# Altium schematic sheet FPGA_VREG.SchDoc
size 297 x 209 mm
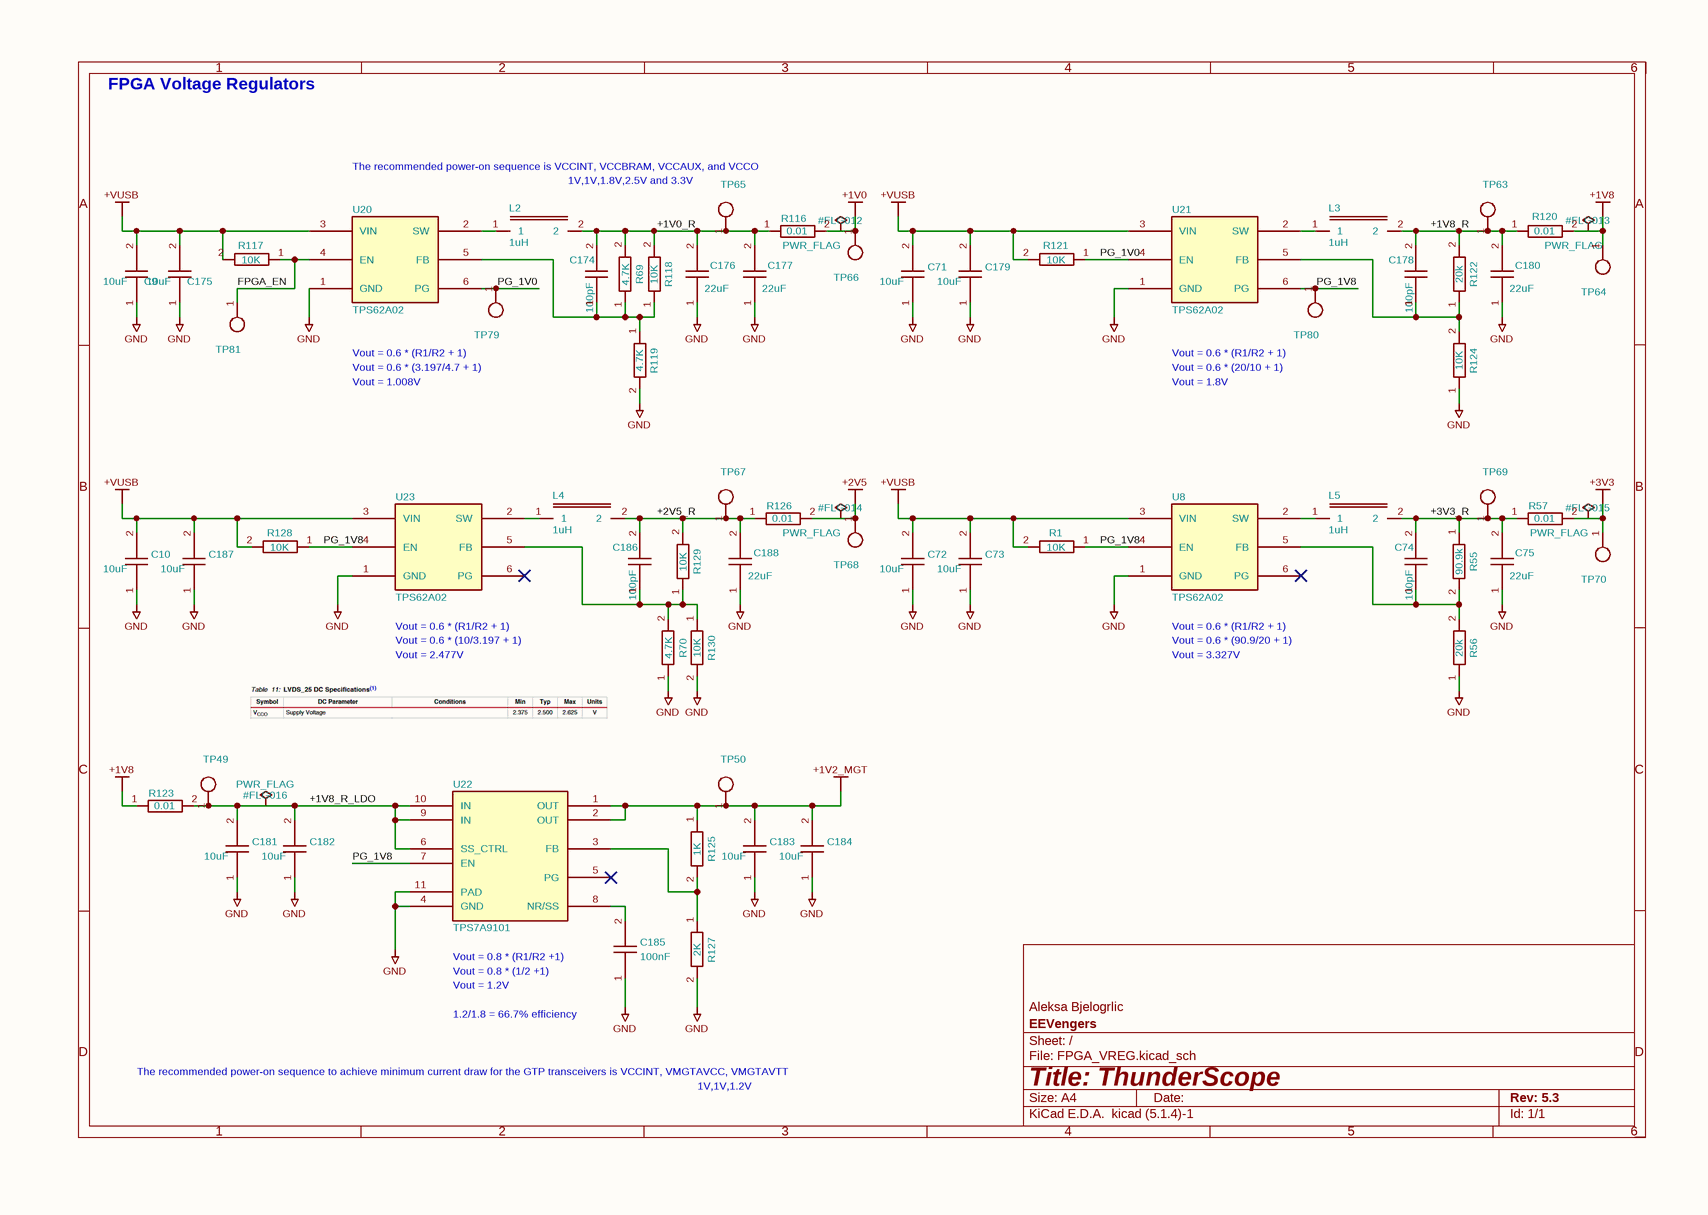
[diagram p0: FPGA_VREG.SchDoc]

## Parts
#FLG012  PWR_FLAG  (graphical)
#FLG013  PWR_FLAG  (graphical)
#FLG014  PWR_FLAG  (graphical)
#FLG015  PWR_FLAG  (graphical)
#FLG016  PWR_FLAG  (graphical)
C9  10uF  [GEN_C_0603]
C10  10uF  [GEN_C_0603]
C71  10uF  [GEN_C_0603]
C72  10uF  [GEN_C_0603]
C73  10uF  [GEN_C_0603]
C74  100pF  [GEN_C_0402]
C75  22uF  [GEN_C_0805]
C174  100pF  [GEN_C_0402]
C175  10uF  [GEN_C_0603]
C176  22uF  [GEN_C_0805]
C177  22uF  [GEN_C_0805]
C178  100pF  [GEN_C_0402]
C179  10uF  [GEN_C_0603]
C180  22uF  [GEN_C_0805]
C181  10uF  [GEN_C_0603]
C182  10uF  [GEN_C_0603]
C183  10uF  [GEN_C_0603]
C184  10uF  [GEN_C_0603]
C185  100nF  [GEN_C_0402]
C186  100pF  [GEN_C_0402]
C187  10uF  [GEN_C_0603]
C188  22uF  [GEN_C_0805]
L2  1uH  [GEN_L_1210]
L3  1uH  [GEN_L_1210]
L4  1uH  [GEN_L_1210]
L5  1uH  [GEN_L_1210]
R1  10K  [GEN_R_0402]
R55  90.9k  [GEN_R_0402]
R56  20k  [GEN_R_0402]
R57  0.01  [GEN_R_0603]
R69  4.7K  [GEN_R_0402]
R70  4.7K  [GEN_R_0402]
R116  0.01  [GEN_R_0603]
R117  10K  [GEN_R_0402]
R118  10K  [GEN_R_0402]
R119  4.7K  [GEN_R_0402]
R120  0.01  [GEN_R_0603]
R121  10K  [GEN_R_0402]
R122  20k  [GEN_R_0402]
R123  0.01  [GEN_R_0603]
R124  10K  [GEN_R_0402]
R125  1K  [GEN_R_0402]
R126  0.01  [GEN_R_0603]
R127  2K  [GEN_R_0402]
R128  10K  [GEN_R_0402]
R129  10K  [GEN_R_0402]
R130  10K  [GEN_R_0402]
TP49  PCB  [GEN_TP_PCB]  (value not drawn)
TP50  PCB  [GEN_TP_PCB]  (value not drawn)
TP63  PCB  [GEN_TP_PCB]  (value not drawn)
TP64  PCB  [GEN_TP_PCB]  (value not drawn)
TP65  PCB  [GEN_TP_PCB]  (value not drawn)
TP66  PCB  [GEN_TP_PCB]  (value not drawn)
TP67  PCB  [GEN_TP_PCB]  (value not drawn)
TP68  PCB  [GEN_TP_PCB]  (value not drawn)
TP69  PCB  [GEN_TP_PCB]  (value not drawn)
TP70  PCB  [GEN_TP_PCB]  (value not drawn)
TP79  PCB  [GEN_TP_PCB]  (value not drawn)
TP80  PCB  [GEN_TP_PCB]  (value not drawn)
TP81  PCB  [GEN_TP_PCB]  (value not drawn)
U8  TPS62A02  [TI_SOT563_DRL0006A]
U20  TPS62A02  [TI_SOT563_DRL0006A]
U21  TPS62A02  [TI_SOT563_DRL0006A]
U22  TPS7A9101  [TI_WSON10_DSK0010A]
U23  TPS62A02  [TI_SOT563_DRL0006A]

## Nets
+1V0: #FLG012.1 R116.2 TP66.1
+1V2_MGT: C183.2 C184.2 R125.1 TP50.1 U22.1(OUT) U22.2(OUT)
+1V8: #FLG013.1 R120.2 R123.1 TP64.1
+2V5: #FLG014.1 R126.2 TP68.1
+3V3: #FLG015.1 R57.2 TP70.1
+VUSB: C9.2 C10.2 C71.2 C72.2 C73.2 C175.2 C179.2 C187.2 R1.2 R117.2 R121.2 R128.2 U8.3(VIN) U20.3(VIN) U21.3(VIN) U23.3(VIN)
GND: C9.1 C10.1 C71.1 C72.1 C73.1 C75.1 C175.1 C176.1 C177.1 C179.1 C180.1 C181.1 C182.1 C183.1 C184.1 C185.1 C187.1 C188.1 R56.1 R70.1 R119.2 R124.1 R127.2 R130.2 U8.1(GND) U20.1(GND) U21.1(GND) U22.4(GND) U22.11(PAD) U23.1(GND)
+1V0_R: C174.2 C176.2 C177.2 L2.2 R69.2 R116.1 R118.2 TP65.1
+1V8_R: C178.2 C180.2 L3.2 R120.1 R122.2 TP63.1
+1V8_R_LDO: #FLG016.1 C181.2 C182.2 R123.2 TP49.1 U22.6(SS_CTRL) U22.9(IN) U22.10(IN)
+2V5_R: C186.2 C188.2 L4.2 R126.1 R129.2 TP67.1
+3V3_R: C74.2 C75.2 L5.2 R55.1 R57.1 TP69.1
FPGA_EN: R117.1 TP81.1 U20.4(EN)
PG_1V0: R121.1 TP79.1 U20.6(PG) U21.4(EN)
PG_1V8: R1.1 R128.1 TP80.1 U8.4(EN) U21.6(PG) U22.7(EN) U23.4(EN)
NetC74_1: C74.1 R55.2 R56.2 U8.5(FB)
NetC174_1: C174.1 R69.1 R118.1 R119.1 U20.5(FB)
NetC178_1: C178.1 R122.1 R124.2 U21.5(FB)
NetC185_2: C185.2 U22.8(NR/SS)
NetC186_1: C186.1 R70.2 R129.1 R130.1 U23.5(FB)
NetL2_1: L2.1 U20.2(SW)
NetL3_1: L3.1 U21.2(SW)
NetL4_1: L4.1 U23.2(SW)
NetL5_1: L5.1 U8.2(SW)
NetR125_2: R125.2 R127.1 U22.3(FB)

Not connected (* = marked no-connect by the designer): U8 6(PG)*; U22 5(PG)*; U23 6(PG)*

## Notes on the sheet
- FPGA Voltage Regulators
- The recommended power-on sequence is VCCINT, VCCBRAM, VCCAUX, and VCCO
- 1V,1V,1.8V,2.5V and 3.3V
- Vout = 0.6 * (R1/R2 + 1)
- Vout = 1.008V
- Vout = 0.6 * (3.197/4.7 + 1)
- Vout = 1.8V
- Vout = 0.6 * (20/10 + 1)
- (near U23) Vout = 0.6 * (R1/R2 + 1)
- Vout = 0.6 * (10/3.197 + 1)
- Vout = 0.6 * (90.9/20 + 1)
- (near U8) Vout = 0.6 * (R1/R2 + 1)
- Vout = 2.477V
- Vout = 3.327V
- Vout = 0.8 * (1/2 +1)
- Vout = 1.2V
- Vout = 0.8 * (R1/R2 +1)
- The recommended power-on sequence to achieve minimum current draw for the GTP transceivers is VCCINT, VMGTAVCC, VMGTAVTT
- 1.2/1.8 = 66.7% efficiency
- 1V,1V,1.2V
- 1
- 2
- 3
- 4
- 5
- 6
- A
- B
- C
- Aleksa Bjelogrlic
- D
- Title: ThunderScope
- File: FPGA_VREG.kicad_sch
- Sheet: /
- EEVengers
- KiCad E.D.A.  kicad (5.1.4)-1
- Size: A4
- Date:
- Rev: 5.3
- Id: 1/1

## Library data of the parts
C9 C10 C71-C73 C175 C179 C181-C184 C187 = CAP 10uF 25V X5R 0603: MANUFACTURER: Murata; MANUFACTURER PART NUMBER: GRM188R61E106MA73D; VOLTAGE RATING: 25V; Substitutions Policy: Any Parametric Equivalent; PACKAGE: 0402; SUPPLIER 1: Mouser; SUPPLIER PART NUMBER 1: 81-GRM188R61E106MA3D; Footprint: Thunderscope_Rev5:GEN_C_0603; Value: 10uF
C74 C174 C178 C186 = CAP 100pF 50V C0G 0402: MANUFACTURER: Murata; MANUFACTURER PART NUMBER: GCM1555C1H101FA16D; TEMPERATURE COEFFICIENT: C0G; VOLTAGE RATING: 50V; Substitutions Policy: Any Parametric Equivalent; PACKAGE: 0402; SUPPLIER 1: Mouser; SUPPLIER PART NUMBER 1: 81-GCM1555C1H101FA6D; Footprint: Thunderscope_Rev5:GEN_C_0402; Value: 100pF
C75 C176 C177 C180 C188 = CAP 22uF 25V X5R 0805: HOUSE PART NUMBER: C-22uF-0805-002; MANUFACTURER: Murata; MANUFACTURER PART NUMBER: GRM21BR61E226ME44L; VOLTAGE RATING: 25V; Substitutions Policy: Any Parametric Equivalent; PACKAGE: 0805; SUPPLIER 1: Mouser; SUPPLIER PART NUMBER 1: 81-GRM21BR61E226ME4L; Footprint: Thunderscope_Rev5:GEN_C_0805; Value: 22uF
C185 = CAP 100nF 16V X7R 0402: HOUSE PART NUMBER: C-100nF-0402-002; MANUFACTURER: Murata; MANUFACTURER PART NUMBER: GCM155R71C104KA55D; VOLTAGE RATING: 16V; Substitutions Policy: Any Parametric Equivalent; PACKAGE: 0402; SUPPLIER 1: Mouser; SUPPLIER PART NUMBER 1: 81-GCM155R71C104KA5D; Footprint: Thunderscope_Rev5:GEN_C_0402; Value: 100nF
L2-L5 = IND 1uH 5.5A 32 MOHM 1210: HOUSE PART NUMBER: SRP3212-1R0M; MANUFACTURER: Bourns; Substitutions Policy: ECO Required for Substitution; SUPPLIER 1: Mouser; SUPPLIER PART NUMBER 1: 652-SRP3212-1R0M; MANUFACTURER PART NUMBER: SRP3212-1R0M; PACKAGE: 1210; Value: 1uH; Footprint: Thunderscope_Rev5:GEN_L_1210
R1 R117 R118 R121 R124 R128-R130 = RES 10K OHM 1% 1/16W 0402: MANUFACTURER: Yageo; MANUFACTURER PART NUMBER: RC0402FR-0710KL; TOLERANCE: 1%; Substitutions Policy: Any Parametric Equivalent; PACKAGE: 0402; SUPPLIER 1: Mouser; SUPPLIER PART NUMBER 1: 603-RC0402FR-0710KL; Footprint: Thunderscope_Rev5:GEN_R_0402; Value: 10K
R55 = RES 90.9K OHM 1% 1/16W 0402: MANUFACTURER: Yageo; MANUFACTURER PART NUMBER: RC0402FR-0790K9L; TOLERANCE: 1%; Substitutions Policy: Any Parametric Equivalent; PACKAGE: 0402; SUPPLIER 1: Mouser; SUPPLIER PART NUMBER 1: 603-RC0402FR-0790K9L; Footprint: Thunderscope_Rev5:GEN_R_0402; Value: 90.9k
R56 R122 = RES 20K OHM 1% 1/16W 0402: MANUFACTURER: Yageo; MANUFACTURER PART NUMBER: RC0402FR-0720KL; TOLERANCE: 1%; Substitutions Policy: Any Parametric Equivalent; PACKAGE: 0402; SUPPLIER 1: Mouser; SUPPLIER PART NUMBER 1: 603-RC0402FR-0720KL; Footprint: Thunderscope_Rev5:GEN_R_0402; Value: 20k
R57 R116 R120 R123 R126 = RES 0.01 OHM 1% 1/4W 0603: HOUSE PART NUMBER: R-0.01-0603-1%-001; MANUFACTURER: Susumu; MANUFACTURER PART NUMBER: RL0816T-R010-F; TOLERANCE: 1%; Substitutions Policy: Any Parametric Equivalent; SUPPLIER 1: Mouser; SUPPLIER PART NUMBER 1: 754-RL0816T-R010-F; PACKAGE: 0603; Footprint: Thunderscope_Rev5:GEN_R_0603; Value: 0.01
R69 R70 R119 = RES 4.7K OHM 1% 1/16W 0402: MANUFACTURER: Yageo; MANUFACTURER PART NUMBER: RC0402FR-074K7L; TOLERANCE: 1%; Substitutions Policy: Any Parametric Equivalent; PACKAGE: 0402; SUPPLIER 1: Mouser; SUPPLIER PART NUMBER 1: 603-RC0402FR-074K7L; Footprint: Thunderscope_Rev5:GEN_R_0402; Value: 4.7K
R125 = RES 1K OHM 1% 1/10W 0402: HOUSE PART NUMBER: R-1K-0402-1%-001; MANUFACTURER: Yageo; MANUFACTURER PART NUMBER: RC0402FR-071KL; TOLERANCE: 1%; Substitutions Policy: Any Parametric Equivalent; PACKAGE: 0402; SUPPLIER 1: Mouser; SUPPLIER PART NUMBER 1: 603-RC0402FR-071KL; Footprint: Thunderscope_Rev5:GEN_R_0402; Value: 1K
R127 = RES 2K OHM 1% 1/16W 0402: MANUFACTURER: Yageo; MANUFACTURER PART NUMBER: RC0402FR-072KL; TOLERANCE: 1%; Substitutions Policy: Any Parametric Equivalent; PACKAGE: 0402; SUPPLIER 1: Mouser; SUPPLIER PART NUMBER 1: 603-RC0402FR-072KL; Footprint: Thunderscope_Rev5:GEN_R_0402; Value: 2K
TP49 TP50 TP63-TP70 TP79-TP81 = TP PCB 1mm: Footprint: Thunderscope_Rev5:GEN_TP_PCB; Value: PCB
U8 U20 U21 U23 = IC BUCK TPS62A02: HOUSE PART NUMBER: TPS62A02DRLR; MANUFACTURER: Texas Instruments; Substitutions Policy: No Substitutions; SUPPLIER 1: Texas Instruments; SUPPLIER PART NUMBER 1: TPS62A02DRLR; MANUFACTURER PART NUMBER: TPS62A02DRLR; PACKAGE: SOT-563; Footprint: Thunderscope_Rev5:TI_SOT563_DRL0006A; Value: TPS62A02
U22 = IC LDO TPS7A9101: MANUFACTURER: Texas Instruments; MANUFACTURER PART NUMBER: TPS7A9101DSKR; Substitutions Policy: No Substitutions; SUPPLIER 1: Texas Instruments; SUPPLIER PART NUMBER 1: TPS7A9101DSKR; PACKAGE: 10-DFN (2.5x2.5mm); Value: TPS7A9101; Footprint: Thunderscope_Rev5:TI_WSON10_DSK0010A
#FLG012 #FLG013 #FLG014 #FLG015 #FLG016 = PWR_FLAG: Value: PWR_FLAG